# Altium schematic sheet TuringSMD_back.SchDoc
size A4; SheetNumber: 2; SheetTotal: 3
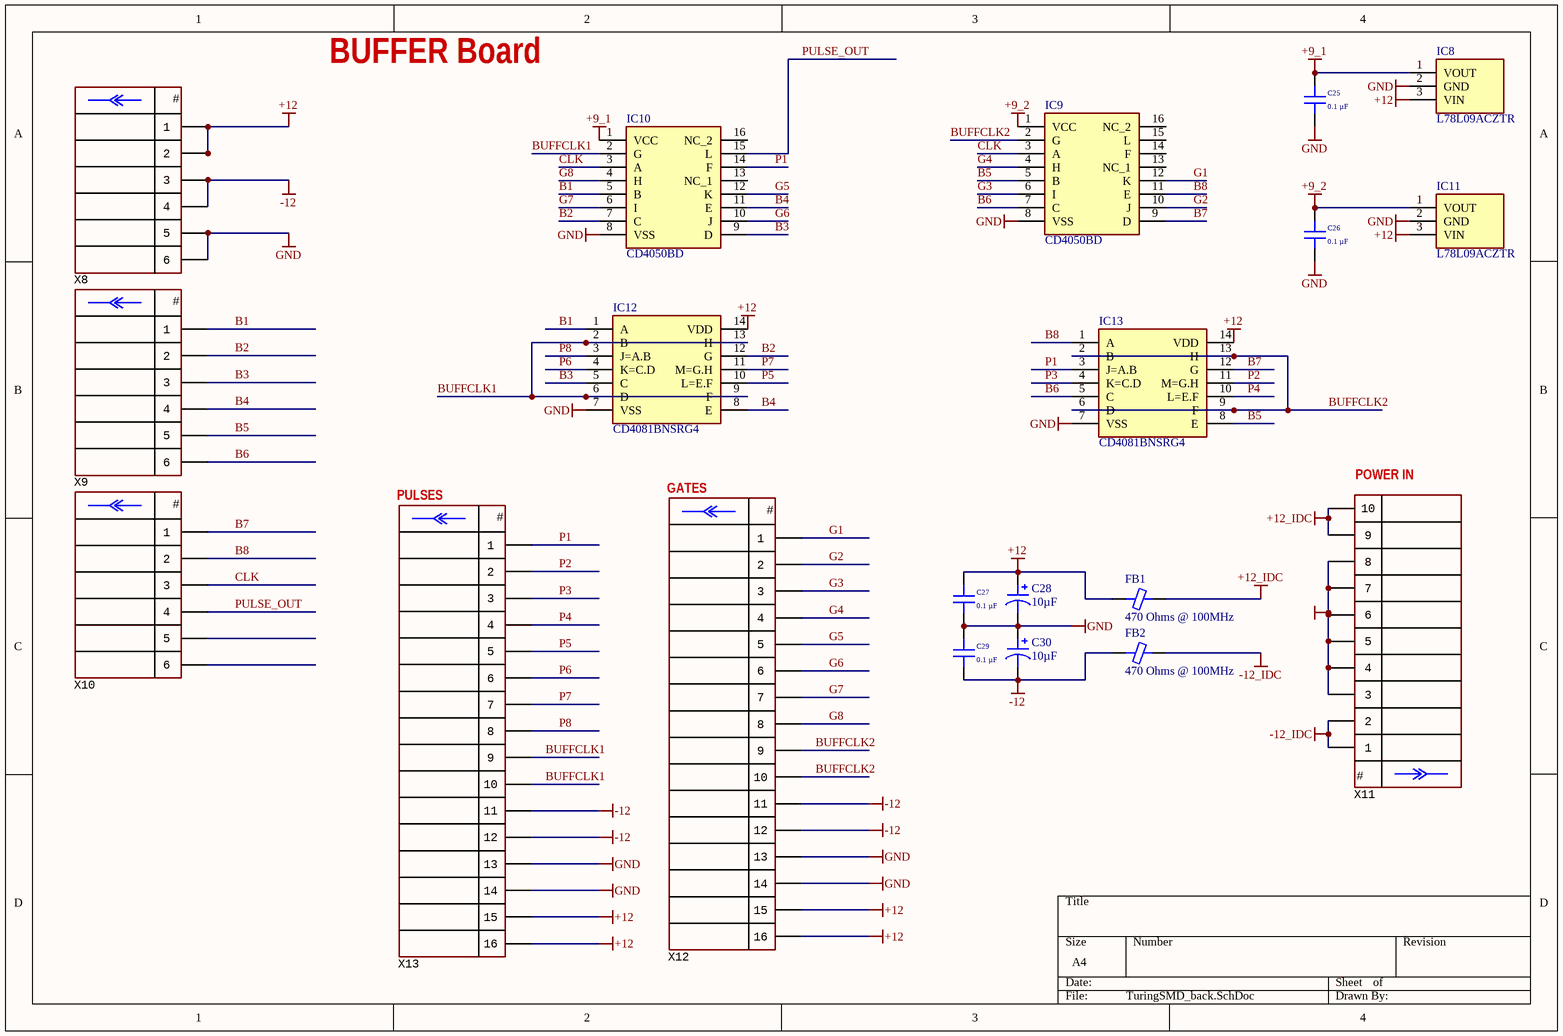
[diagram p0: TuringSMD_back.SchDoc]

## Parts
C25  0.1 µF  [CAP 0603_1608]
C26  0.1 µF  [CAP 0603_1608]
C27  0.1 µF  [CAP 0603_1608]
C28  10µF  [CAP POL 1411_3528]
C29  0.1 µF  [CAP 0603_1608]
C30  10µF  [CAP POL 1411_3528]
FB1  470 Ohms @ 100MHz  [FER 0805_2012]
FB2  470 Ohms @ 100MHz  [FER 0805_2012]
IC8  L78L09ACZTR  [TS1107A1AP]
IC9  CD4050BD  [SOIC127P600X175-16N]
IC10  CD4050BD  [SOIC127P600X175-16N]
IC11  L78L09ACZTR  [TS1107A1AP]
IC12  CD4081BNSRG4  [SOIC127P780X200-14N]
IC13  CD4081BNSRG4  [SOIC127P780X200-14N]
X8  (no value)  [CON: PBD-6]
X9  (no value)  [CON: PBD-6]
X10  (no value)  [CON: PBD-6]
X11  (no value)  [CON: IDC-10MS]
X12  (no value)  [CON: IDC-16MS]
X13  (no value)  [CON: IDC-16MS]

## Nets
+9_1: C25.2 IC8.1(VOUT) IC10.1(VCC)
+9_2: C26.2 IC9.1(VCC) IC11.1(VOUT)
+12: C27.2 C28.1 FB1.1 IC8.3(VIN) IC11.3(VIN) IC12.14(VDD) IC13.14(VDD) X8.1 X8.2 X12.15 X12.16 X13.15 X13.16
+12_IDC: FB1.2 X11.9 X11.10
-12: C29.1 C30.2 FB2.1 X8.3 X8.4 X12.11 X12.12 X13.11 X13.12
-12_IDC: FB2.2 X11.1 X11.2
GND: C25.1 C26.1 C27.1 C28.2 C29.2 C30.1 IC8.2(GND) IC9.8(VSS) IC10.8(VSS) IC11.2(GND) IC12.7(VSS) IC13.7(VSS) X8.5 X8.6 X11.3 X11.4 X11.5 X11.6 X11.7 X11.8 X12.13 X12.14 X13.13 X13.14
B1: IC10.5(B) IC12.1(A) X9.1
B2: IC10.7(C) IC12.12(G) X9.2
B3: IC10.9(D) IC12.5(C) X9.3
B4: IC10.11(E) IC12.8(E) X9.4
B5: IC9.5(B) IC13.8(E) X9.5
B6: IC9.7(C) IC13.5(C) X9.6
B7: IC9.9(D) IC13.12(G) X10.1
B8: IC9.11(E) IC13.1(A) X10.2
BUFFCLK1: IC10.2(G) IC12.2(B) IC12.6(D) IC12.9(F) IC12.13(H) X13.9 X13.10
BUFFCLK2: IC9.2(G) IC13.2(B) IC13.6(D) IC13.9(F) IC13.13(H) X12.9 X12.10
CLK: IC9.3(A) IC10.3(A) X10.3
G1: IC9.12(K) X12.1
G2: IC9.10(J) X12.2
G3: IC9.6(I) X12.3
G4: IC9.4(H) X12.4
G5: IC10.12(K) X12.5
G6: IC10.10(J) X12.6
G7: IC10.6(I) X12.7
G8: IC10.4(H) X12.8
P1: IC10.14(F) IC13.3(J=A.B) X13.1
P2: IC13.11(M=G.H) X13.2
P3: IC13.4(K=C.D) X13.3
P4: IC13.10(L=E.F) X13.4
P5: IC12.10(L=E.F) X13.5
P6: IC12.4(K=C.D) X13.6
P7: IC12.11(M=G.H) X13.7
P8: IC12.3(J=A.B) X13.8
PULSE_OUT: IC10.15(L) X10.4

Not connected (* = marked no-connect by the designer): IC9 13(NC_1) 14(F) 15(L) 16(NC_2); IC10 13(NC_1) 16(NC_2); X10 5 6

## Notes on the sheet
- BUFFER Board
- PULSES
- GATES
- (near X11) POWER IN
- (in symbol IDC-10) #
- (in symbol IDC-16) #
- (in symbol PBD-6) #

## Library data of the parts
C25-C27 C29 = C0603C104K5RAC7411: CAP CER 0.1UF 50V X7R 0603; manufacturer: KEMET; Tolerance: ±10%; Part Number: C0603C104K5RAC7411; Value: 0.1 µF; Applications: Bypass, Decoupling; Capacitance: 0.1 µF; componentlink1description: Datasheet; componentlink1url: https://api.kemet.com/component-edge/download/datasheet/C0603C104K5RAC7411.pdf; componentlink2description: DigiKey Link; componentlink2url: https://www.digikey.com/en/products/detail/kemet/C0603C104K5RAC7411/3317013; Device Package: 0603 (1608 Metric); lastupdated: 2/9/2024 8:10:30 PM; Lifecycle Status: Active; Minimum Order: 1; Mounting Type: Surface Mount, MLCC; Operating Temperature: -55°C ~ 125°C; Package / Case: 0603 (1608 Metric); packaging: TapeAndReel; partid: 2233; Part Status: Active; price: 0.01; series: SMD Comm X7R; Size / Dimension: 0.063" L x 0.031" W (1.60mm x 0.80mm); Supplier 1: DigiKey; Supplier Part Number 1: 399-C0603C104K5RAC7411CT-ND; Temperature Coefficient: X7R; Thickness (Max): 0.035" (0.90mm); Voltage - Rated: 50V
C28 C30 = TAJB106K025RNJ: CAP TANT 10UF 10% 25V 1411; manufacturer: AVX Corporation; Manufacturer Size Code: B; ESR (Equivalent Series Resistance): 2.5Ohm; Type: Molded; Part Number: TAJB106K025RNJ; Value: 10µF; Capacitance: 10µF; componentlink1description: Datasheet; componentlink1url: http://datasheets.avx.com/TAJ.pdf; componentlink2description: DigiKey Link; componentlink2url: http://digikey.com/product-detail/en/avx-corporation/TAJB106K025RNJ/478-5257-1-ND/1950924; Features: General Purpose; Height - Seated (Max): 0.083" (2.10mm); lastupdated: 9/2/2020 1:15:45 AM; Lifecycle Status: Active; Minimum Order: 1; Mounting Type: Surface Mount; Operating Temperature: -55°C ~ 125°C; Package / Case: 1411 (3528 Metric), 1210; packaging: TapeAndReel; partid: 206; Part Status: Active; price: 0.16; series: TAJ; Size / Dimension: 0.138" L x 0.110" W (3.50mm x 2.80mm); Supplier 1: DigiKey; Supplier Part Number 1: 478-5257-1-ND; Tolerance: ±10%; Voltage - Rated: 25V
FB1 FB2 = BLM21SP471SH1D: FERRITEBEAD SMD Z100MHZ=470OHM 2; Manufacturer: Murata Electronics; Current Rating (Max): 2.5A; Filter Type: Power Line; Number of Lines: 1; Part Number: BLM21SP471SH1D; ComponentLink1Description: Datasheet; ComponentLink1URL: https://www.murata.com/en-us/api/pdfdownloadapi?cate=luNoiseSupprFilteChipFerriBead&partno=BLM21SP471SH1%23; ComponentLink2Description: DigiKey Link; ComponentLink2URL: http://digikey.com/product-detail/en/murata-electronics/BLM21SP471SH1D/490-18587-1-ND/10135598; Device Package: 0805 (2012 Metric); Height (Max): 0.041" (1.05mm); Impedance @ Frequency: 470 Ohms @ 100MHz; LastUpdated: 9/2/2020 1:18:23 AM; Lifecycle Status: Active; Minimum Order: 1; Mounting Type: Surface Mount; Operating Temperature: -55°C ~ 125°C; Package / Case: 0805 (2012 Metric); Packaging: TapeAndReel; PartId: 1234; Part Status: Active; Price: 0.09; Ratings: AEC-Q200; Series: EMIFIL®, BLM21; Size / Dimension: 0.079" L x 0.049" W (2.00mm x 1.25mm); Supplier 1: DigiKey; Supplier Part Number 1: 490-18587-1-ND; Value: 470 Ohms @ 100MHz
IC8 IC11 = L78L09ACZTR: Integrated Circuit; Manufacturer_Name: STMicroelectronics; Datasheet Link: https://datasheet.datasheetarchive.com/originals/distributors/Datasheets-302/26642.pdf; Height: 4.95mm; Manufacturer_Part_Number: L78L09ACZTR
IC9 IC10 = CD4050BD: Integrated Circuit; Manufacturer_Name: Texas Instruments; Datasheet Link: http://www.ti.com/lit/gpn/cd4050b; Height: 1.75mm; Manufacturer_Part_Number: CD4050BD; Mouser Part Number: 595-CD4050BD; Mouser Price/Stock: https://www.mouser.co.uk/ProductDetail/Texas-Instruments/CD4050BD?qs=KIIz7VjqD7KKcecgSZzn4w%3D%3D; Arrow Part Number: CD4050BD; Arrow Price/Stock: https://www.arrow.com/en/products/cd4050bd/texas-instruments?region=nac
IC12 IC13 = CD4081BNSRG4: Integrated Circuit; Manufacturer_Name: Texas Instruments; Datasheet Link: https://www.ti.com/lit/gpn/cd4081b; Height: 2mm; Manufacturer_Part_Number: CD4081BNSRG4; Mouser Part Number: 595-CD4081BNSRG4; Mouser Price/Stock: https://www.mouser.com/Search/Refine.aspx?Keyword=595-CD4081BNSRG4
X8-X10 = PBD-6: Manufacturer: Connfly; ValueManufacturerPartNumber: Connector, 6pin, 2.54mm, 500VAC, 3A; TypeConnector: Connector; VoltageMax: 500VAC; Pitch: 2.54mm; CurrentMax: 3A; Multichannel: 6pin; CommentText: "Разъем"; HelpURL: https://www.chipdip.ru/product/pbd-6; PartNumber: PBD-6
X11 = IDC-10: Manufacturer: Connfly; ValueManufacturerPartNumber: Connector, 10pin, 2.54mm, 250VAC, 3A; TypeConnector: Connector; VoltageMax: 250VAC; Pitch: 2.54mm; CurrentMax: 3A; Multichannel: 10pin; CommentText: "Разъем"; HelpURL: https://www.chipdip.ru/product/idc-10ms; PartNumber: IDC-10
X12 X13 = IDC-16: Manufacturer: Connfly; ValueManufacturerPartNumber: Connector, 16pin, 2.54mm, 250VAC, 3A; TypeConnector: Connector; VoltageMax: 250VAC; Pitch: 2.54mm; CurrentMax: 3A; Multichannel: 16pin; CommentText: "Разъем"; HelpURL: https://www.chipdip.ru/product/idc-16ms; PartNumber: IDC-16